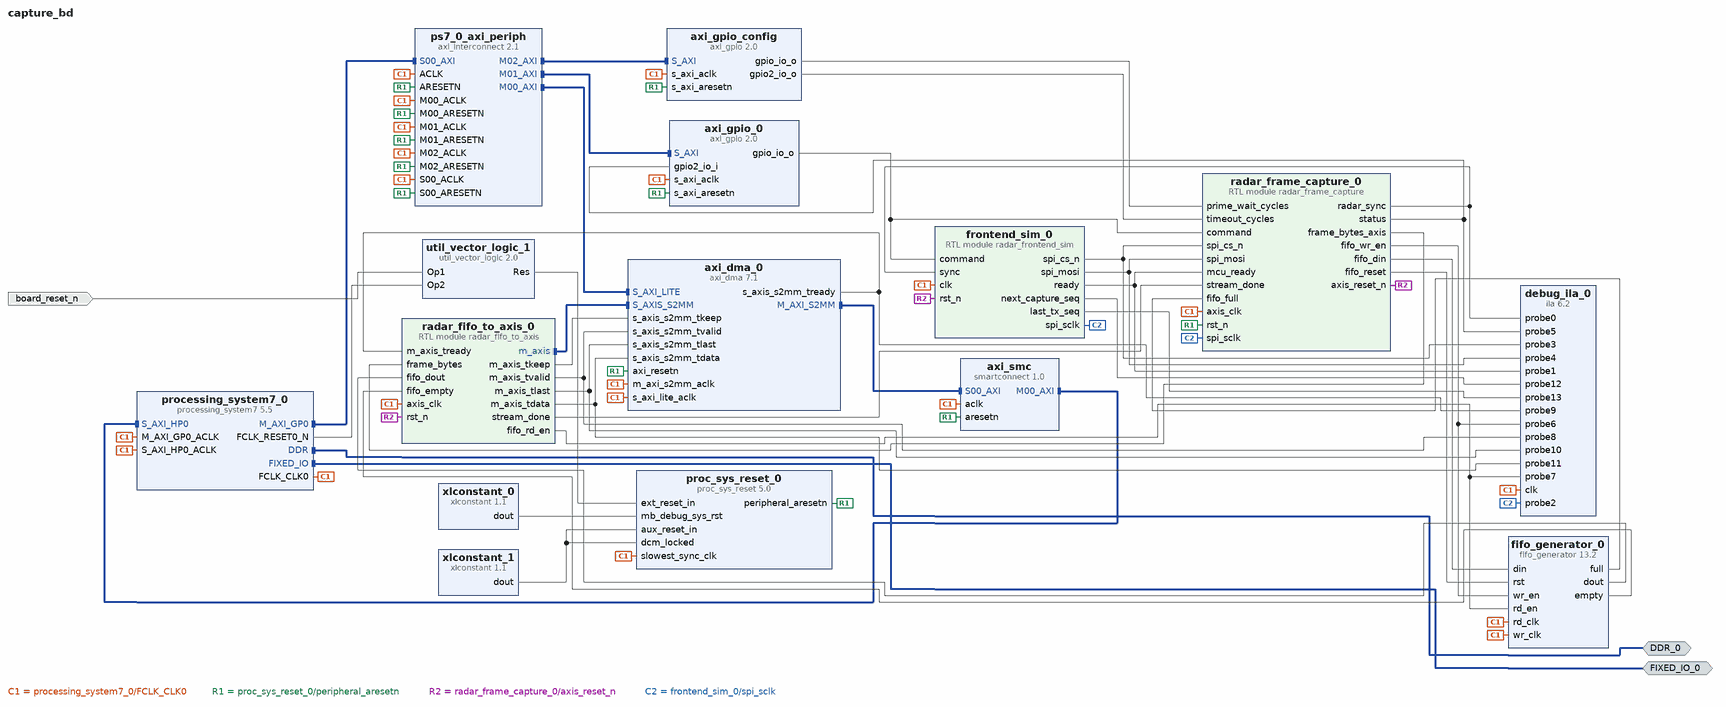
[diagram p0: block diagram of the top level]
# Vivado block design capture_bd, xc7z035ffg900-2, Vivado 2018.3
create_bd_design capture_bd

create_bd_intf_port -mode Master -vlnv xilinx.com:interface:ddrx_rtl:1.0 DDR_0
create_bd_intf_port -mode Master -vlnv xilinx.com:display_processing_system7:fixedio_rtl:1.0 FIXED_IO_0
create_bd_port -dir I -type rst board_reset_n
set_property -dict {CONFIG.POLARITY ACTIVE_LOW} [get_bd_ports board_reset_n]

create_bd_cell -type ip -vlnv xilinx.com:ip:fifo_generator:13.2 fifo_generator_0
set_property -dict [list \
  CONFIG.Fifo_Implementation Independent_Clocks_Builtin_FIFO \
  CONFIG.Input_Data_Width 32 \
  CONFIG.Performance_Options First_Word_Fall_Through \
] [get_bd_cells fifo_generator_0]
create_bd_cell -type ip -vlnv xilinx.com:ip:axi_dma:7.1 axi_dma_0
set_property -dict {CONFIG.c_include_mm2s 0 CONFIG.c_include_sg 0 CONFIG.c_sg_length_width 16} [get_bd_cells axi_dma_0]
create_bd_cell -type ip -vlnv xilinx.com:ip:processing_system7:5.5 processing_system7_0
set_property -dict [list \
  CONFIG.PCW_FPGA0_PERIPHERAL_FREQMHZ 100 \
  CONFIG.PCW_PRESET_BANK1_VOLTAGE {LVCMOS 3.3V} \
  CONFIG.PCW_S_AXI_HP0_DATA_WIDTH 32 \
  CONFIG.PCW_UART0_PERIPHERAL_ENABLE 1 \
  CONFIG.PCW_UART0_UART0_IO {MIO 14 .. 15} \
  CONFIG.PCW_UART_PERIPHERAL_FREQMHZ 100 \
  CONFIG.PCW_UIPARAM_DDR_FREQ_MHZ 533.333333 \
  CONFIG.PCW_UIPARAM_DDR_MEMORY_TYPE {DDR 3 (Low Voltage)} \
  CONFIG.PCW_UIPARAM_DDR_PARTNO {MT41K256M16 RE-125} \
  CONFIG.PCW_USE_S_AXI_HP0 1 \
] [get_bd_cells processing_system7_0]
# 101 more settings of processing_system7_0 are not shown: defaults, MIO pin electricals, DDR timing, and values the tool derives
create_bd_cell -type ip -vlnv xilinx.com:ip:proc_sys_reset:5.0 proc_sys_reset_0
create_bd_cell -type ip -vlnv xilinx.com:ip:util_vector_logic:2.0 util_vector_logic_1
set_property -dict {CONFIG.C_SIZE 1} [get_bd_cells util_vector_logic_1]
create_bd_cell -type ip -vlnv xilinx.com:ip:xlconstant:1.1 xlconstant_0
set_property -dict {CONFIG.CONST_VAL 0} [get_bd_cells xlconstant_0]
create_bd_cell -type ip -vlnv xilinx.com:ip:xlconstant:1.1 xlconstant_1
set_property -dict {CONFIG.CONST_VAL 1} [get_bd_cells xlconstant_1]
create_bd_cell -type ip -vlnv xilinx.com:ip:axi_interconnect:2.1 ps7_0_axi_periph
set_property -dict {CONFIG.NUM_MI 3} [get_bd_cells ps7_0_axi_periph]
create_bd_cell -type ip -vlnv xilinx.com:ip:smartconnect:1.0 axi_smc
set_property -dict {CONFIG.NUM_SI 1} [get_bd_cells axi_smc]
create_bd_cell -type ip -vlnv xilinx.com:ip:axi_gpio:2.0 axi_gpio_0
set_property -dict [list \
  CONFIG.C_ALL_INPUTS_2 1 \
  CONFIG.C_ALL_OUTPUTS 1 \
  CONFIG.C_GPIO2_WIDTH 32 \
  CONFIG.C_GPIO_WIDTH 32 \
  CONFIG.C_IS_DUAL 1 \
] [get_bd_cells axi_gpio_0]
create_bd_cell -type ip -vlnv xilinx.com:ip:axi_gpio:2.0 axi_gpio_config
set_property -dict [list \
  CONFIG.C_ALL_OUTPUTS 1 \
  CONFIG.C_ALL_OUTPUTS_2 1 \
  CONFIG.C_GPIO2_WIDTH 32 \
  CONFIG.C_GPIO_WIDTH 32 \
  CONFIG.C_IS_DUAL 1 \
] [get_bd_cells axi_gpio_config]
create_bd_cell -type module -reference radar_frame_capture radar_frame_capture_0
create_bd_cell -type module -reference radar_fifo_to_axis radar_fifo_to_axis_0
create_bd_cell -type ip -vlnv xilinx.com:ip:ila:6.2 debug_ila_0
set_property -dict [list \
  CONFIG.C_DATA_DEPTH 4096 \
  CONFIG.C_MONITOR_TYPE Native \
  CONFIG.C_NUM_OF_PROBES 14 \
  CONFIG.C_PROBE0_WIDTH 1 \
  CONFIG.C_PROBE10_WIDTH 1 \
  CONFIG.C_PROBE11_WIDTH 32 \
  CONFIG.C_PROBE12_WIDTH 16 \
  CONFIG.C_PROBE13_WIDTH 16 \
  CONFIG.C_PROBE1_WIDTH 1 \
  CONFIG.C_PROBE2_WIDTH 1 \
  CONFIG.C_PROBE3_WIDTH 1 \
  CONFIG.C_PROBE4_WIDTH 1 \
  CONFIG.C_PROBE5_WIDTH 32 \
  CONFIG.C_PROBE6_WIDTH 1 \
  CONFIG.C_PROBE7_WIDTH 1 \
  CONFIG.C_PROBE8_WIDTH 1 \
  CONFIG.C_PROBE9_WIDTH 1 \
] [get_bd_cells debug_ila_0]
create_bd_cell -type module -reference radar_frontend_sim frontend_sim_0

# ---- connections ----

connect_bd_intf_net [get_bd_intf_pins processing_system7_0/M_AXI_GP0] [get_bd_intf_pins ps7_0_axi_periph/S00_AXI]
connect_bd_intf_net [get_bd_intf_pins ps7_0_axi_periph/M00_AXI] [get_bd_intf_pins axi_dma_0/S_AXI_LITE]
connect_bd_intf_net [get_bd_intf_pins axi_dma_0/M_AXI_S2MM] [get_bd_intf_pins axi_smc/S00_AXI]
connect_bd_intf_net [get_bd_intf_pins radar_fifo_to_axis_0/m_axis] [get_bd_intf_pins axi_dma_0/S_AXIS_S2MM]
connect_bd_intf_net [get_bd_intf_pins ps7_0_axi_periph/M01_AXI] [get_bd_intf_pins axi_gpio_0/S_AXI]
connect_bd_intf_net [get_bd_intf_pins ps7_0_axi_periph/M02_AXI] [get_bd_intf_pins axi_gpio_config/S_AXI]
connect_bd_intf_net [get_bd_intf_ports DDR_0] [get_bd_intf_pins processing_system7_0/DDR]
connect_bd_intf_net [get_bd_intf_ports FIXED_IO_0] [get_bd_intf_pins processing_system7_0/FIXED_IO]
connect_bd_intf_net [get_bd_intf_pins axi_smc/M00_AXI] [get_bd_intf_pins processing_system7_0/S_AXI_HP0]
connect_bd_net -net adc_capture_pack_0_fifo_din [get_bd_pins radar_frame_capture_0/fifo_din] [get_bd_pins fifo_generator_0/din]
connect_bd_net -net adc_capture_pack_0_fifo_wr_en [get_bd_pins radar_frame_capture_0/fifo_wr_en] \
  [get_bd_pins fifo_generator_0/wr_en] [get_bd_pins debug_ila_0/probe6]
connect_bd_net [get_bd_pins fifo_generator_0/full] [get_bd_pins radar_frame_capture_0/fifo_full]
connect_bd_net [get_bd_pins fifo_generator_0/dout] [get_bd_pins radar_fifo_to_axis_0/fifo_dout]
connect_bd_net [get_bd_pins fifo_generator_0/empty] [get_bd_pins radar_fifo_to_axis_0/fifo_empty]
connect_bd_net -net fifo_to_axis_0_fifo_rd_en [get_bd_pins radar_fifo_to_axis_0/fifo_rd_en] \
  [get_bd_pins fifo_generator_0/rd_en] [get_bd_pins debug_ila_0/probe7]
connect_bd_net [get_bd_pins processing_system7_0/FCLK_CLK0] \
  [get_bd_pins processing_system7_0/M_AXI_GP0_ACLK] [get_bd_pins processing_system7_0/S_AXI_HP0_ACLK] \
  [get_bd_pins axi_dma_0/s_axi_lite_aclk] [get_bd_pins axi_dma_0/m_axi_s2mm_aclk] [get_bd_pins fifo_generator_0/rd_clk] \
  [get_bd_pins proc_sys_reset_0/slowest_sync_clk] [get_bd_pins ps7_0_axi_periph/ACLK] [get_bd_pins ps7_0_axi_periph/S00_ACLK] \
  [get_bd_pins ps7_0_axi_periph/M00_ACLK] [get_bd_pins axi_smc/aclk] [get_bd_pins axi_gpio_0/s_axi_aclk] \
  [get_bd_pins ps7_0_axi_periph/M01_ACLK] [get_bd_pins axi_gpio_config/s_axi_aclk] [get_bd_pins ps7_0_axi_periph/M02_ACLK] \
  [get_bd_pins fifo_generator_0/wr_clk] [get_bd_pins radar_frame_capture_0/axis_clk] \
  [get_bd_pins radar_fifo_to_axis_0/axis_clk] [get_bd_pins debug_ila_0/clk] [get_bd_pins frontend_sim_0/clk]
connect_bd_net [get_bd_pins processing_system7_0/FCLK_RESET0_N] [get_bd_pins util_vector_logic_1/Op2]
connect_bd_net [get_bd_pins util_vector_logic_1/Res] [get_bd_pins proc_sys_reset_0/ext_reset_in]
connect_bd_net [get_bd_pins xlconstant_0/dout] [get_bd_pins proc_sys_reset_0/mb_debug_sys_rst]
connect_bd_net [get_bd_pins xlconstant_1/dout] [get_bd_pins proc_sys_reset_0/dcm_locked] [get_bd_pins proc_sys_reset_0/aux_reset_in]
connect_bd_net [get_bd_pins proc_sys_reset_0/peripheral_aresetn] \
  [get_bd_pins axi_dma_0/axi_resetn] [get_bd_pins ps7_0_axi_periph/S00_ARESETN] [get_bd_pins ps7_0_axi_periph/M00_ARESETN] \
  [get_bd_pins ps7_0_axi_periph/ARESETN] [get_bd_pins axi_smc/aresetn] [get_bd_pins axi_gpio_0/s_axi_aresetn] \
  [get_bd_pins ps7_0_axi_periph/M01_ARESETN] [get_bd_pins axi_gpio_config/s_axi_aresetn] \
  [get_bd_pins ps7_0_axi_periph/M02_ARESETN] [get_bd_pins radar_frame_capture_0/rst_n]
connect_bd_net [get_bd_pins axi_gpio_0/gpio_io_o] [get_bd_pins radar_frame_capture_0/command] [get_bd_pins frontend_sim_0/command]
connect_bd_net -net adc_board_control_0_status [get_bd_pins radar_frame_capture_0/status] \
  [get_bd_pins axi_gpio_0/gpio2_io_i] [get_bd_pins debug_ila_0/probe5]
connect_bd_net [get_bd_ports board_reset_n] [get_bd_pins util_vector_logic_1/Op1]
connect_bd_net [get_bd_pins axi_gpio_config/gpio_io_o] [get_bd_pins radar_frame_capture_0/prime_wait_cycles]
connect_bd_net [get_bd_pins axi_gpio_config/gpio2_io_o] [get_bd_pins radar_frame_capture_0/timeout_cycles]
connect_bd_net -net measurement_core_0_fifo_reset [get_bd_pins radar_frame_capture_0/fifo_reset] [get_bd_pins fifo_generator_0/rst]
connect_bd_net [get_bd_pins radar_frame_capture_0/axis_reset_n] [get_bd_pins radar_fifo_to_axis_0/rst_n] [get_bd_pins frontend_sim_0/rst_n]
connect_bd_net [get_bd_pins radar_frame_capture_0/frame_bytes_axis] [get_bd_pins radar_fifo_to_axis_0/frame_bytes]
connect_bd_net [get_bd_pins radar_fifo_to_axis_0/stream_done] [get_bd_pins radar_frame_capture_0/stream_done]
connect_bd_net -net spi_sclk_1 [get_bd_pins frontend_sim_0/spi_sclk] [get_bd_pins radar_frame_capture_0/spi_sclk] [get_bd_pins debug_ila_0/probe2]
connect_bd_net -net spi_cs_n_1 [get_bd_pins frontend_sim_0/spi_cs_n] [get_bd_pins radar_frame_capture_0/spi_cs_n] [get_bd_pins debug_ila_0/probe3]
connect_bd_net -net spi_mosi_1 [get_bd_pins frontend_sim_0/spi_mosi] [get_bd_pins radar_frame_capture_0/spi_mosi] [get_bd_pins debug_ila_0/probe4]
connect_bd_net [get_bd_pins radar_frame_capture_0/radar_sync] [get_bd_pins debug_ila_0/probe0] [get_bd_pins frontend_sim_0/sync]
connect_bd_net -net mcu_ready_1 [get_bd_pins frontend_sim_0/ready] [get_bd_pins radar_frame_capture_0/mcu_ready] [get_bd_pins debug_ila_0/probe1]
connect_bd_net [get_bd_pins radar_fifo_to_axis_0/m_axis_tvalid] [get_bd_pins debug_ila_0/probe8] [get_bd_pins axi_dma_0/s_axis_s2mm_tvalid]
connect_bd_net [get_bd_pins axi_dma_0/s_axis_s2mm_tready] [get_bd_pins radar_fifo_to_axis_0/m_axis_tready] [get_bd_pins debug_ila_0/probe9]
connect_bd_net [get_bd_pins radar_fifo_to_axis_0/m_axis_tlast] [get_bd_pins debug_ila_0/probe10] [get_bd_pins axi_dma_0/s_axis_s2mm_tlast]
connect_bd_net [get_bd_pins radar_fifo_to_axis_0/m_axis_tdata] [get_bd_pins debug_ila_0/probe11] [get_bd_pins axi_dma_0/s_axis_s2mm_tdata]
connect_bd_net [get_bd_pins frontend_sim_0/next_capture_seq] [get_bd_pins debug_ila_0/probe12]
connect_bd_net [get_bd_pins frontend_sim_0/last_tx_seq] [get_bd_pins debug_ila_0/probe13]
connect_bd_net [get_bd_pins radar_fifo_to_axis_0/m_axis_tkeep] [get_bd_pins axi_dma_0/s_axis_s2mm_tkeep]

# ---- address map ----
assign_bd_address -offset 0x00000000 -range 512M -target_address_space [get_bd_addr_spaces axi_dma_0/Data_S2MM] [get_bd_addr_segs processing_system7_0/S_AXI_HP0/HP0_DDR_LOWOCM]
assign_bd_address -offset 0x40400000 -range 64K -target_address_space [get_bd_addr_spaces processing_system7_0/Data] [get_bd_addr_segs axi_dma_0/S_AXI_LITE/Reg]
assign_bd_address -offset 0x41200000 -range 64K -target_address_space [get_bd_addr_spaces processing_system7_0/Data] [get_bd_addr_segs axi_gpio_0/S_AXI/Reg]
assign_bd_address -offset 0x41210000 -range 64K -target_address_space [get_bd_addr_spaces processing_system7_0/Data] [get_bd_addr_segs axi_gpio_config/S_AXI/Reg]

validate_bd_design
save_bd_design
